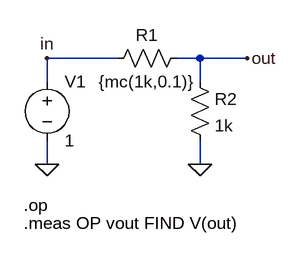
[diagram p0: schematic divider_op.asc]
divider_op.asc, the LTspice schematic file:
Version 4
SHEET 1 880 680
WIRE 16 96 112 96
WIRE 192 96 224 96
WIRE 224 96 288 96
WIRE 16 128 16 96
WIRE 224 128 224 96
WIRE 16 240 16 208
WIRE 224 240 224 208
FLAG 16 240 0
FLAG 224 240 0
FLAG 288 96 out
FLAG 16 96 in
SYMBOL voltage 16 112 R0
SYMATTR InstName V1
SYMATTR Value 1
SYMBOL res 208 80 R90
WINDOW 0 0 56 VBottom 2
WINDOW 3 32 56 VTop 2
SYMATTR InstName R1
SYMATTR Value {mc(1k,0.1)}
SYMBOL res 208 112 R0
SYMATTR InstName R2
SYMATTR Value 1k
TEXT -16 296 Left 2 !.op
TEXT -16 320 Left 2 !.meas OP vout FIND V(out)

The netlist it stands for:
* divider_op.asc
V1 in 0 1
R1 out in {mc(1k,0.1)}
R2 out 0 1k
.op
.meas OP vout FIND V(out)
.backanno
.end